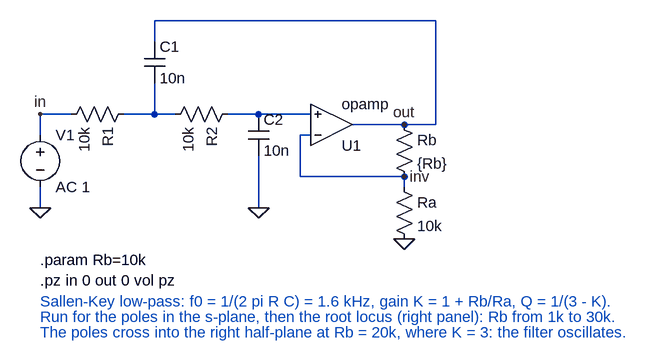
[diagram p0: schematic pz_sallen_key.asc]
pz_sallen_key.asc, the LTspice schematic file:
Version 4
SHEET 1 880 680
WIRE 0 144 0 112
WIRE 0 112 48 112
WIRE 128 112 176 112
WIRE 176 112 208 112
WIRE 176 64 176 112
WIRE 176 0 176 -32
WIRE 176 -32 608 -32
WIRE 608 -32 608 128
WIRE 288 112 336 112
WIRE 336 112 416 112
WIRE 336 112 336 112
WIRE 336 176 336 256
WIRE 480 128 560 128
WIRE 560 128 608 128
WIRE 560 128 560 128
WIRE 560 208 560 224
WIRE 560 208 400 208
WIRE 400 208 400 144
WIRE 400 144 416 144
WIRE 0 224 0 256
FLAG 0 112 in
FLAG 560 128 out
FLAG 560 208 inv
FLAG 0 256 0
FLAG 336 256 0
FLAG 560 304 0
SYMBOL voltage 0 128 R0
SYMATTR InstName V1
SYMATTR Value AC 1
SYMBOL res 144 96 R90
SYMATTR InstName R1
SYMATTR Value 10k
SYMBOL res 304 96 R90
SYMATTR InstName R2
SYMATTR Value 10k
SYMBOL cap 160 0 R0
SYMATTR InstName C1
SYMATTR Value 10n
SYMBOL cap 320 112 R0
SYMATTR InstName C2
SYMATTR Value 10n
SYMBOL Opamps\opamp 448 192 M180
SYMATTR InstName U1
SYMBOL res 544 112 R0
SYMATTR InstName Rb
SYMATTR Value {Rb}
SYMBOL res 544 208 R0
SYMATTR InstName Ra
SYMATTR Value 10k
TEXT 0 336 Left 2 !.param Rb=10k
TEXT 0 368 Left 2 !.pz in 0 out 0 vol pz
TEXT 0 400 Left 2 ;Sallen-Key low-pass: f0 = 1/(2 pi R C) = 1.6 kHz, gain K = 1 + Rb/Ra, Q = 1/(3 - K).
TEXT 0 424 Left 2 ;Run for the poles in the s-plane, then the root locus (right panel): Rb from 1k to 30k.
TEXT 0 448 Left 2 ;The poles cross into the right half-plane at Rb = 20k, where K = 3: the filter oscillates.

The netlist it stands for:
* pz_sallen_key.asc
V1 in 0 AC 1
R1 N001 in 10k
R2 N002 N001 10k
C1 out N001 10n
C2 N002 0 10n
XU1 inv N002 out opamp Aol=100K GBW=10Meg  ; pins invin noninvin out
Rb out inv {Rb}
Ra inv 0 10k
.param Rb=10k
.pz in 0 out 0 vol pz
* Sallen-Key low-pass: f0 = 1/(2 pi R C) = 1.6 kHz, gain K = 1 + Rb/Ra, Q = 1/(3 - K).
* Run for the poles in the s-plane, then the root locus (right panel): Rb from 1k to 30k.
* The poles cross into the right half-plane at Rb = 20k, where K = 3: the filter oscillates.
.backanno
.end